# EAGLE design ELE Can-Bus Shield-V1.5-20190730-01 (EAGLE 8.2.0)
DESCRIPTION: microOBD 200 OBD-II Module; HW_REV: 1.4; PCB_REV: C; PCB_SPEC1: Layer Count: 4; PCB_SPEC2: Size: 1.3" x 0.59"; PCB_SPEC3: Finish Thickness: 0.049" - 0.052"; PCB_SPEC4: Copper Weight: 1oz; TITLE: STM1120
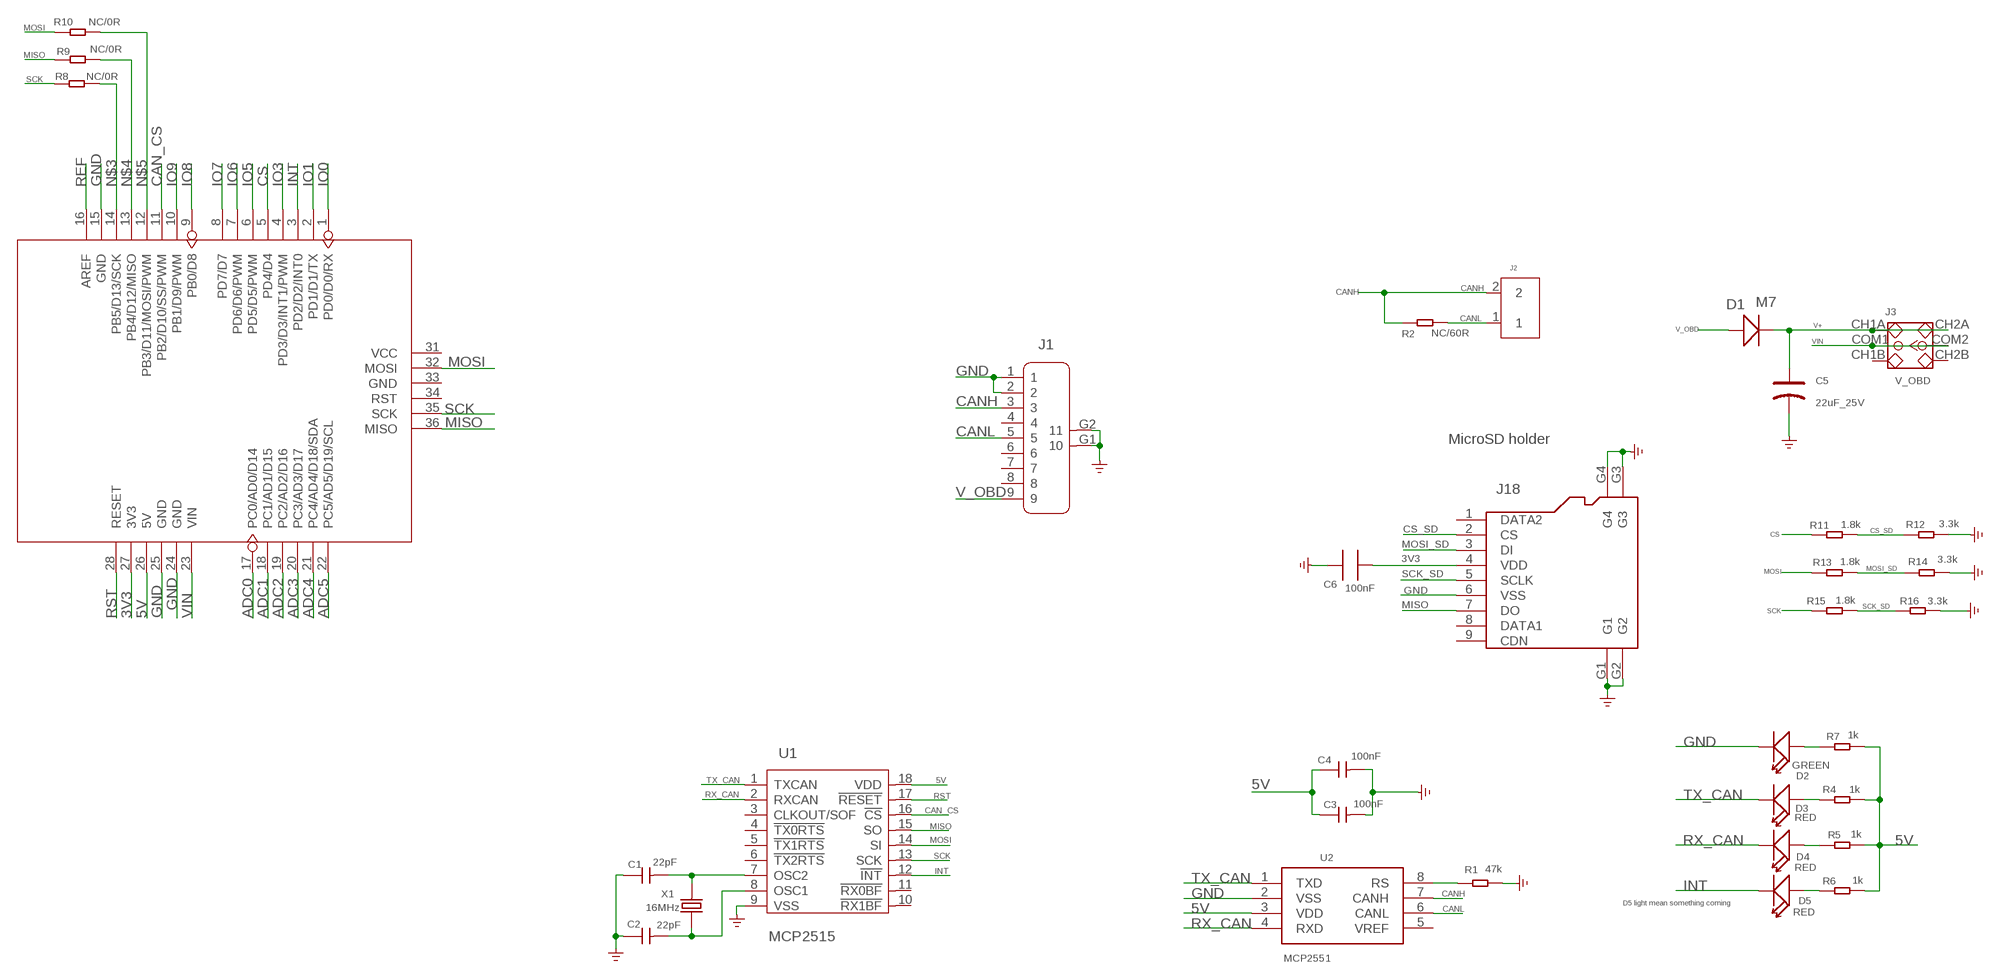
[diagram p0: schematic, sheet 1]

## Parts
C1  22pF  C-0603  [0603]
C2  22pF  C-0603  [0603]
C3  100nF  C-0603  [0603]
C4  100nF  C-0603  [0603]
C5  22uF_25V  CAP-AVX-C  [AVX-C]
C6  100nF  C0603  [0603]
D1  M7  D-SMA  [D2010]
D2  GREEN  LED'0603'  [LED-0603]
D3  RED  LED'0603'  [LED-0603]
D4  RED  LED'0603'  [LED-0603]
D5  RED  LED'0603'  [LED-0603]
J1  DB9'MEAL'  [DB9-MEAL]
J2  SCREW-TERMINAL-2P5.0  [2P-5.0]
J3  V_OBD  SWITCH-2CH-6P  [6P-2CH-2.54-7.6X3.0]
J18  HOLDER-MICROSD-9P  [9P-SMD-W/-RING]
R1  47k  R-0603  [R0603]
R2  NC/60R  R0603  [0603]
R4  1k  R-0603  [R0603]
R5  1k  R-0603  [R0603]
R6  1k  R-0603  [R0603]
R7  1k  R-0603  [R0603]
R8  NC/0R  DISCRETE_R-0603  [DISCRETE_R0603]
R9  NC/0R  DISCRETE_R-0603  [DISCRETE_R0603]
R10  NC/0R  DISCRETE_R-0603  [DISCRETE_R0603]
R11  1.8k  R0603  [0603]
R12  3.3k  R0603  [0603]
R13  1.8k  R0603  [0603]
R14  3.3k  R0603  [0603]
R15  1.8k  R0603  [0603]
R16  3.3k  R0603  [0603]
U1  MCP2515  [SOIC18]
U2  MCP2551  [SO08]
U4  ARDUINO  [ARDUINO]
X1  16MHz  CRYSTAL-HC49S  [HC49/S]

## Nets
3V3: C6.2 J18.4(VDD) U4.27(3V3)
5V: C3.1 C4.1 R4.2 R5.2 R6.2 R7.2 U1.18(VDD) U2.3(VDD) U4.26(5V)
ADC0: U4.17(PC0/AD0/D14)
ADC1: U4.18(PC1/AD1/D15)
ADC2: U4.19(PC2/AD2/D16)
ADC3: U4.20(PC3/AD3/D17)
ADC4: U4.21(PC4/AD4/D18/SDA)
ADC5: U4.22(PC5/AD5/D19/SCL)
CAN_CS: U1.16(!CS) U4.11(PB2/D10/SS/PWM)
CANH: J1.3 J2.2 R2.1 U2.7(CANH)
CANL: J1.5 J2.1 R2.2 U2.6(CANL)
CS: R11.1 U4.5(PD4/D4)
CS_SD: J18.2(CS) R11.2 R12.1
GND: C1.1 C2.1 C3.2 C4.2 C5.- C6.1 D2.- J1.1 J1.2 J1.G1 J1.G2 J18.6(VSS) J18.G1 J18.G2 J18.G3 J18.G4 R1.2 R12.2 R14.2 R16.2 U1.9(VSS) U2.2(VSS) U4.15(GND) U4.24(GND) U4.25(GND)
INT: D5.- U1.12(!INT) U4.3(PD2/D2/INT0)
IO0: U4.1(PD0/D0/RX)
IO1: U4.2(PD1/D1/TX)
IO3: U4.4(PD3/D3/INT1/PWM)
IO5: U4.6(PD5/D5/PWM)
IO6: U4.7(PD6/D6/PWM)
IO7: U4.8(PD7/D7)
IO8: U4.9(PB0/D8)
IO9: U4.10(PB1/D9/PWM)
MISO: J18.7(DO) R9.2 U1.15(SO) U4.36(MISO)
MOSI: R10.2 R13.1 U1.14(SI) U4.32(MOSI)
MOSI_SD: J18.3(DI) R13.2 R14.1
N$1: D2.+ R7.1
N$2: D3.+ R4.1
N$3: R8.1 U4.14(PB5/D13/SCK)
N$4: R9.1 U4.13(PB4/D12/MISO)
N$5: R10.1 U4.12(PB3/D11/MOSI/PWM)
N$15: D4.+ R5.1
N$16: C1.2 U1.7(OSC2) X1.2
N$17: C2.2 U1.8(OSC1) X1.1
N$19: D5.+ R6.1
N$20: R1.1 U2.8(RS)
REF: U4.16(AREF)
RST: U1.17(!RESET) U4.28(RESET)
RX_CAN: D4.- U1.2(RXCAN) U2.4(RXD)
SCK: R8.2 R15.1 U1.13(SCK) U4.35(SCK)
SCK_SD: J18.5(SCLK) R15.2 R16.1
TX_CAN: D3.- U1.1(TXCAN) U2.1(TXD)
V+: C5.+ D1.- J3.CH1A J3.CH2A
V_OBD: D1.+ J1.9
VIN: J3.COM1 J3.COM2 U4.23(VIN)
Unconnected: J1.4 J1.6 J1.7 J1.8 J3.CH1B J3.CH2B J18.1(DATA2) J18.8(DATA1) J18.9(CDN) U1.3(CLKOUT/SOF) U1.4(!TX0RTS) U1.5(!TX1RTS) U1.6(!TX2RTS) U1.10(!RX1BF) U1.11(!RX0BF) U2.5(VREF) U4.31(VCC) U4.33(GND) U4.34(RST)

## Notes on the sheet
- MicroSD holder
- D5 light mean something coming

## Library data of the parts
C1-C4 = Discrete:C*: Ceramic Capacitors
C5 = Discrete:CAP*: Electrolytic Capacitors,Tantalum Capacitors and Super Capacitors
C6 = CPT_SMD:C0603; C0603: 100N
D1 = Discrete:D*
D2-D5 = Discrete:LED*
J1 = Connector:DB9
J2 = Connector:SCREW-TERMINAL-2P
J3 = Discrete:SWITCH-2CH-6P
J18 = Connector:HOLDER-MICROSD-9P
R1 R4-R7 = Discrete:R*
R2 R11-R16 = CPT_SMD:R0603
R8-R10 = A_xbj:DISCRETE_R*
U1 = IC:MCP2515: Stand-Alone CAN Controller With SPI Interface
U2 = IC:MCP2551: High-Speed CAN Transceiver http://ww1.microchip.com/downloads/en/devicedoc/21667f.pdf
U4 = moudle:ARDUINO
X1 = Discrete:CRYSTAL*: CRYSTAL

## Net classes
0 default: width 0.305 mm, drill 0.305 mm, clearance 0.305 mm

## Board
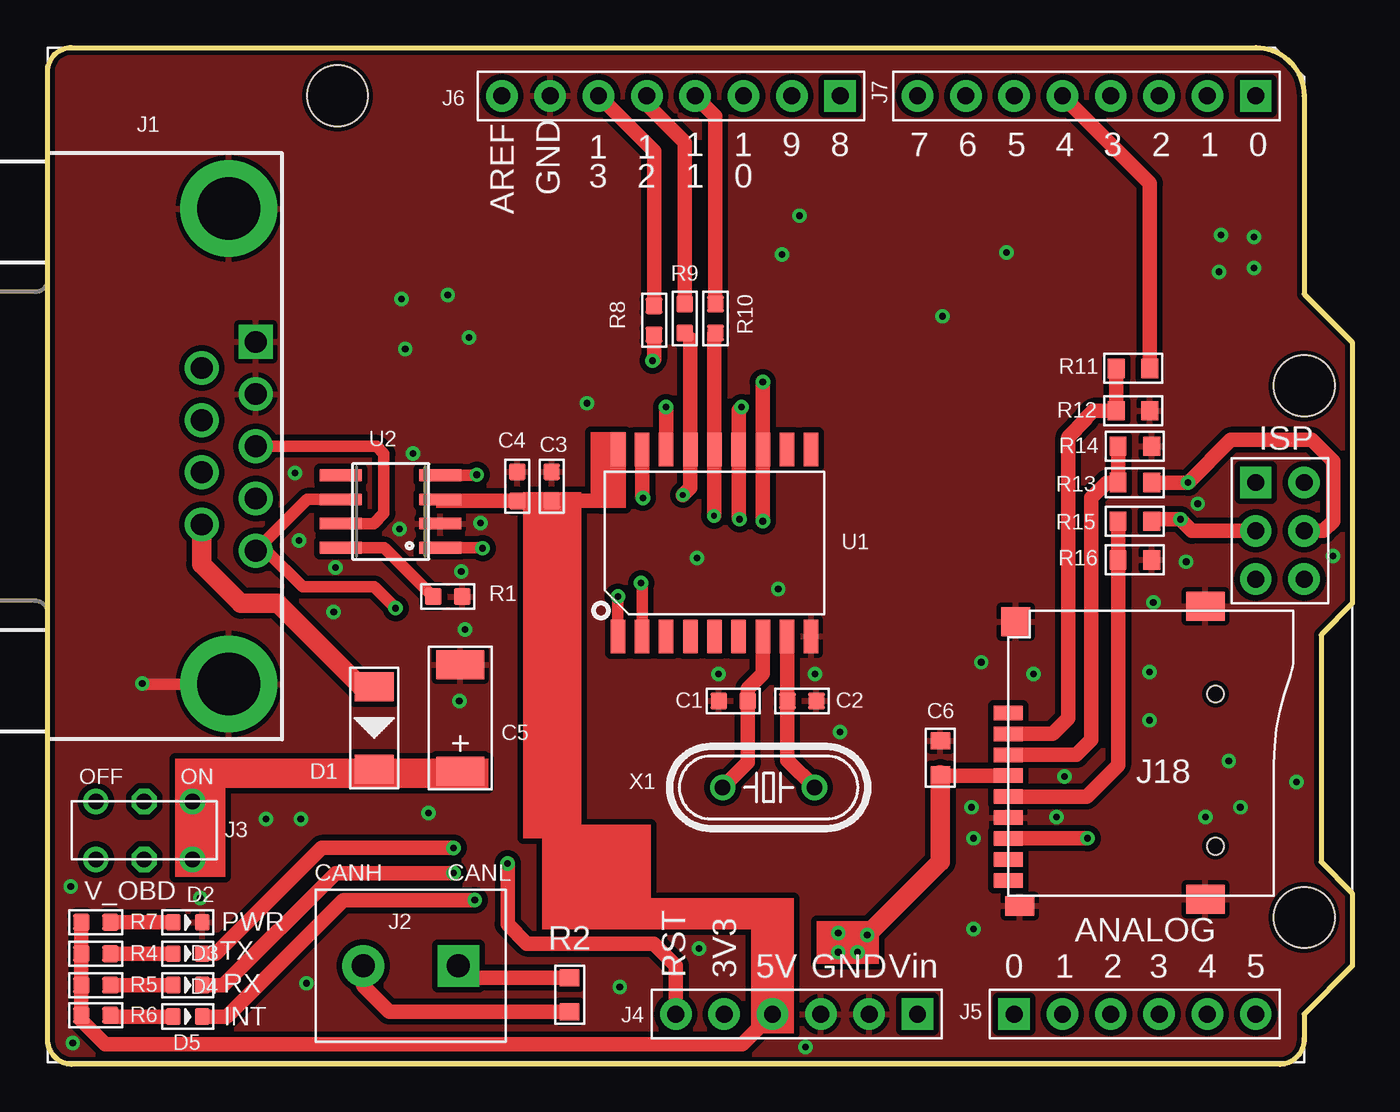
[diagram p1: board, top side]
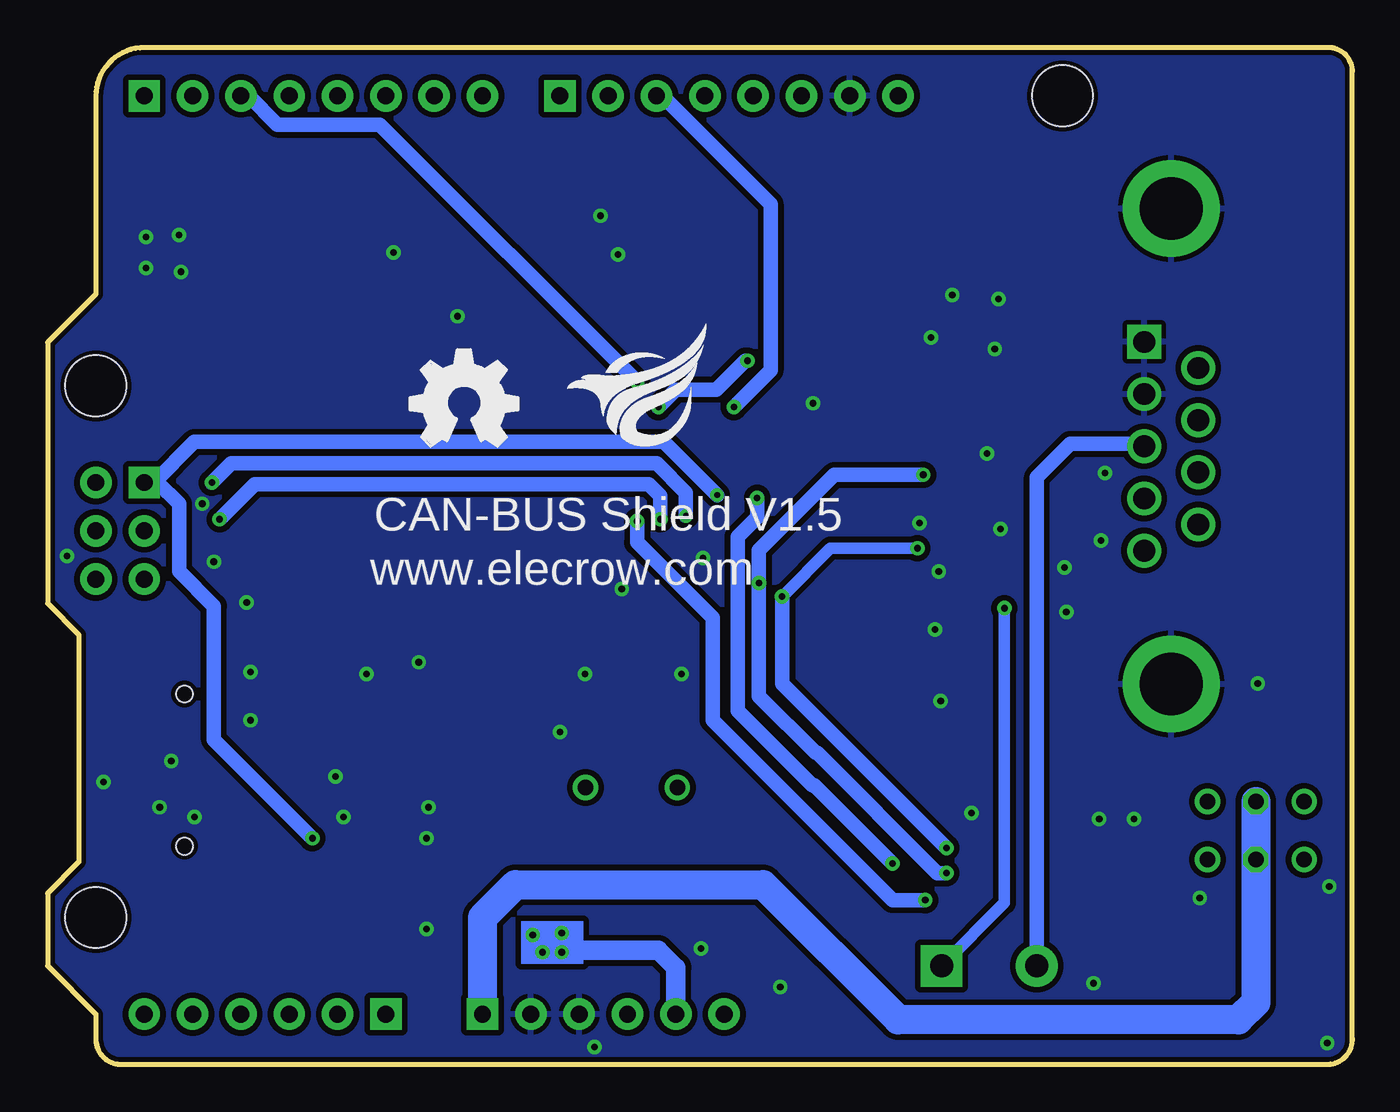
[diagram p2: board, bottom side, seen from below]

Size 68.58 x 53.44 mm. Coordinates in mm from the lower left corner, seen from the top.
Outline: 66.04,2.64 66.04,1.37 arc-90 64.77,0 1.27,0 arc-90 0,1.37 0,52.17 arc-90 1.27,53.44 63.5,53.44 arc-90 66.04,50.9 66.04,40.49 68.58,37.95 68.58,24.23 66.93,22.58 66.93,10.64 68.58,8.99 68.58,5.18 66.04,2.64
Copper layers (1*16): Top 0.035mm / dielectric 1.5mm / Bottom 0.035mm
Design rules "default *": minimum track width 10mil, minimum drill 12mil, track to track 8mil, track to pad 8mil, pad to pad 8mil, via to via 8mil, smd to smd 8mil, copper to edge 10mil, drill to drill 8mil, minimum pad ring 10mil, minimum via ring 8mil, stop-mask expansion 4mil, vias tented up to drill 100mil, thermal gap 10mil

### Footprints (pad centres in the part's own frame; a part is rotated, then mirrored left to right if it is on the bottom)
0603 = smd 0.889 x 0.889: 1 -0.762,0; 2 0.762,0
AVX-C = smd 1.524 x 2.54: + -2.794,0; - 2.794,0
0603' = smd 0.889 x 1.016: 1 -0.889,0; 2 0.889,0
D2010 = smd 1.524 x 2.032: + -2.159,0; - 2.159,0
LED-0603 = smd 0.762 x 0.889: + -0.762,0; - 0.762,0
DB9-MEAL = drill 1.143 pad 1.778 square: 1 -5.486,1.422 | drill 1.143 pad 1.778: 2 -2.743,1.422; 3 0,1.422; 4 2.743,1.422; 5 5.486,1.422; 6 -4.115,-1.422; 7 -1.372,-1.422; 8 1.372,-1.422; 9 4.115,-1.422 | drill 3.302 pad 5.08: G1 12.497,0; G2 -12.497,0
2P-5.0 = drill 1.2 pad 2.184 square: 1 0,0 | drill 1.2 pad 2.184: 2 5,0
6P-2CH-2.54-7.6X3.0 = drill 0.813 pad 1.27: CH1A -1.524,2.54; CH1B -1.524,-2.54; CH2A 1.524,2.54; CH2B 1.524,-2.54 | drill 0.813 pad 1.27 octagon: COM1 -1.524,0; COM2 1.524,0
9P-SMD-W/-RING = smd 1.524 x 0.762: 1 0,4.4; 2 0,3.3; 3 0,2.2; 4 0,1.1; 5 0,0; 6 0,-1.1; 7 0,-2.2; 8 0,-3.3; 9 0,-4.4 | smd 1.524 x 1.016: G1 0.6,-5.746 | smd 2.032 x 1.524: G2 10.373,-5.4; G3 10.373,10 | smd 1.524 x 1.524: G4 0.392,9.181 | hole 0.889: 10.9,-2.6; 10.9,5.4
R0603 = smd 0.889 x 0.889: 1 -0.762,0; 2 0.762,0
DISCRETE_R0603 = smd 0.889 x 0.889: 1 -0.762,0; 2 0.762,0
SOIC18 = smd 0.762 x 1.778: 1 -5.08,-4.915; 2 -3.81,-4.915; 3 -2.54,-4.915; 4 -1.27,-4.915; 5 0,-4.915; 6 1.27,-4.915; 7 2.54,-4.915; 8 3.81,-4.915; 9 5.08,-4.915; 10 5.08,4.915; 11 3.81,4.915; 12 2.54,4.915; 13 1.27,4.915; 14 0,4.915; 15 -1.27,4.915; 16 -2.54,4.915; 17 -3.81,4.915; 18 -5.08,4.915
SO08 = smd 0.61 x 2.21: 1 -1.905,-2.616; 2 -0.635,-2.616; 3 0.635,-2.616; 4 1.905,-2.616; 5 1.905,2.616; 6 0.635,2.616; 7 -0.635,2.616; 8 -1.905,2.616
ARDUINO = drill 0.889 pad 1.651 square: 1 63.5,50.8; 9 41.656,50.8; 17 50.8,2.54; 23 45.72,2.54; 36 63.5,30.48 | drill 0.889 pad 1.651: 2 60.96,50.8; 3 58.42,50.8; 4 55.88,50.8; 5 53.34,50.8; 6 50.8,50.8; 7 48.26,50.8; 8 45.72,50.8; 10 39.116,50.8; 11 36.576,50.8; 12 34.036,50.8; 13 31.496,50.8; 14 28.956,50.8; 15 26.416,50.8; 16 23.876,50.8; 18 53.34,2.54; 19 55.88,2.54; 20 58.42,2.54; 21 60.96,2.54; 22 63.5,2.54; 24 43.18,2.54; 25 40.64,2.54; 26 38.1,2.54; 27 35.56,2.54; 28 33.02,2.54; 31 66.04,30.48; 32 66.04,27.94; 33 66.04,25.4; 34 63.5,25.4; 35 63.5,27.94 | hole 3.2: 15.24,50.8; 66.04,35.56; 66.04,7.62
HC49/S = drill 0.813: 1 -2.413,0; 2 2.413,0

### Placement (x,y rotation side)
C1  36.04,19.1 0 top
C2  39.65,19.1 180 top
C3  26.49,30.38 90 top
C4  24.69,30.38 90 top
C5  21.69,18.21 90 top
C6  100nF  [0603']  46.93,16.12 270 top
D1  17.17,17.68 270 top
D2  7.37,7.47 0 top
D3  7.37,5.82 0 top
D4  7.37,4.17 0 top
D5  7.37,2.51 0 top
J1  9.53,32.49 270 top
J2  21.59,5.18 180 top
J3  5.08,12.29 270 top
J18  50.48,14.07 0 top
R1  21.03,24.59 0 top
R2  NC/60R  [0603']  27.43,3.66 90 top
R4  2.54,5.82 180 top
R5  2.54,4.17 180 top
R6  2.54,2.58 180 top
R7  2.54,7.47 180 top
R8  31.88,39.1 270 top
R9  33.49,39.2 270 top
R10  35.1,39.2 270 top
R11  1.8k  [0603']  57.05,36.58 180 top
R12  3.3k  [0603']  57.05,34.35 0 top
R13  1.8k  [0603']  57.15,30.58 180 top
R14  3.3k  [0603']  57.15,32.49 0 top
R15  1.8k  [0603']  57.15,28.55 180 top
R16  3.3k  [0603']  57.15,26.52 0 top
U1  35.05,27.41 0 top
U2  18.03,29.06 90 top
U4  0,0.1 0 top
U$1  [ELECROW_NRW_6]  41.27,32.49 0 bottom
U$2  [OSHW_FILLX200_NOTEXT]  49.53,32.49 0 bottom
X1  37.9,14.55 180 top

### Tracks (layer width: path | path; a pad name or v marks a point on that pad's centre or on a via)
3V3  (via drill 0.35)
  Top 0.61: v43.08,6.81 41.66,6.81 v41.55,6.91 | v43.08,6.81 42.47,6.81 v41.55,5.89 | v43.08,6.81 43.08,6.4 v42.57,5.89
  Top 0.762: J18.4 46.98,15.17 C6.2
  Top 1.016: C6.2 46.93,10.66 v43.08,6.81
  Bottom 0.61: v41.55,6.91 41.45,6.91 40.54,5.99
  Bottom 1.016: U4.27 35.56,5.08 36.47,5.99 40.54,5.99 42.27,5.99 v43.08,6.81
5V
  Top 0.61: U2.3 24.61,29.69 C4.1
  Top 0.762: C4.1 C3.1 | C3.1 29.11,29.62 29.97,30.48 U1.18 | R7.2 R4.2 R5.2 R6.2 1.78,2.31 3.04,1.05 36.51,1.05 U4.26 38.1,6.6 36.78,7.92 31.5,7.92 26.49,12.93 C3.1
CAN_CS  (via drill 0.35)
  Top 0.762: U1.16 v32.51,34.54
  Bottom 0.762: U4.11 36.27,50.9 30.58,45.21 30.58,36.47 v32.51,34.54
CANH
  Top 0.61: J1.3 17.3,32.49 17.68,32.11 17.68,28.96 17.14,28.42 U2.7
  Top 0.762: J2.2 16.59,4.14 17.96,2.77 R2.1
  Bottom 0.762: J2.2 16.59,30.86 14.83,32.61 11.07,32.61 J1.3
CANL  (via drill 0.35)
  Top 0.61: U2.6 13.64,29.69 J1.5 11.51,27 13.41,25.1 17.17,25.1 v18.29,23.98
  Top 0.762: R2.2 22.23,4.55 J2.1
  Bottom 0.61: v18.29,23.98 18.29,8.48 J2.1
CS
  Top 0.762: R11.1 57.94,46.3 U4.5
CS_SD
  Top 0.762: J18.2 52.83,17.37 53.65,18.19 53.65,32.97 54.57,33.9 54.57,33.95 54.97,34.34 56.15,34.34 | R12.1 56.15,34.34 | R11.2 R12.1 | R12.1 56.15,34.34
GND  (via drill 0.35 pad 0.55)
  Top 0.61: J1.G1 5,19.99 v4.98,20.02
  other vias: 53.44,15.14 39.83,0.91 39.52,44.6 38.61,42.57 47.04,39.32 50.39,42.67 41.66,17.48 48.56,13.51 48.67,11.89 21.95,22.86 34.14,26.62 38.4,24.99 28.35,34.75 11.48,12.9 13.31,12.9 1.22,9.35 1.32,1.12 18.49,28.14 22.76,28.45 19.2,32.11 13,31.09 13.21,27.53 15.14,26.11 67.56,26.72 60.45,29.46 59.84,26.42 58.12,24.28 53.04,13 15.04,23.77 35.26,20.52 40.34,20.52 8.03,8.74 18.59,40.23 21.03,40.44 18.8,37.59 22.15,38.2 60.86,13 62.08,15.95 62.69,13.51 65.63,14.83 48.67,7.11 57.91,18.08 57.91,20.62 49.07,21.13 51.82,20.52 21.64,19.1 20.02,13.21 21.74,25.91 61.67,43.59 61.57,41.66 63.4,43.48 63.4,41.86 30.07,4.06 34.24,6.1 13.61,4.27
  pour Top: -6.1,56.08 -6.1,-3.45 71.73,-3.45 71.73,56.08
  pour Bottom: -4.78,54.76 -4.78,-2.34 70.41,-2.34 70.41,54.76
INT  (via drill 0.35)
  Top 0.762: v37.59,28.55 U1.12 v37.59,35.86 | v22.45,8.64 15.54,8.64 9.42,2.51 D5.-
  Bottom 0.762: v37.59,28.55 37.59,27.43 33.63,23.47 33.63,18.1 24.16,8.64 v22.45,8.64 | v37.59,35.86 51.12,49.39 56.51,49.39 58.02,50.9 U4.3
MISO  (via drill 0.3, 0.35)
  Top 0.762: v33.39,29.92 33.78,30.31 U1.15 33.78,38.15 R9.2 | v54.66,11.89 50.5,11.89 J18.7
  Bottom 0.762: v33.39,29.92 36.18,32.72 60.86,32.72 62.99,30.58 U4.36 62.79,30.58 61.67,29.46 61.67,25.91 59.84,24.08 59.84,17.07 v54.66,11.89
MOSI  (via drill 0.3, 0.35)
  Top 0.762: R10.2 35.05,38.39 U1.14 35.05,29.57 | R13.1 v59.94,30.58 62.18,32.82 66.45,32.82 67.56,31.7 67.56,28.55 67.06,28.04 U4.32 | 35.03,28.85 35.05,28.88 35.05,29.57 | 35.05,29.57 35.05,28.85 v35.03,28.83
  Bottom 0.762: v59.94,30.58 58.93,31.6 36.58,31.6 35.03,30.05 v35.03,28.83
MOSI_SD
  Top 0.762: J18.3 54.07,16.27 54.86,17.07 54.86,29.77 55.68,30.58 R13.2 R14.1
N$1
  Top 0.762: R7.1 D2.+
N$2
  Top 0.762: D3.+ R4.1
N$3
  Top 0.762: R8.1 31.88,47.98 U4.14
N$4
  Top 0.762: R9.1 33.49,48.46 33,48.95 31.5,50.46 U4.13
N$5
  Top 0.762: U4.12 35.1,49.83 R10.1
N$15
  Top 0.762: D4.+ R5.1
N$16
  Top 0.762: X1.2 36.8,15.87 C1.2 36.8,19.74 37.59,20.52 U1.7
N$17
  Top 0.762: X1.1 38.89,15.98 C2.2 38.89,22.47 U1.8
N$19
  Top 0.762: D5.+ 3.37,2.51 R6.1
N$20
  Top 0.61: R1.1 17.7,27.15 U2.8
RST  (via drill 0.35)
  Top 0.762: U1.17 31.24,29.82 v31.29,29.77 | v24.18,10.57 24.18,7.37 25.2,6.35 31.85,6.35 33.02,5.18 U4.28
  Bottom 0.762: v31.29,29.77 31.29,28.75 32.31,27.74 32.31,18.59 28.4,14.68 28.3,14.68 v24.18,10.57
RX_CAN  (via drill 0.35)
  Top 0.61: U2.4 22.53,30.96 v22.55,30.99 | U1.2 31.24,25.25 v31.19,25.3
  Top 0.762: D4.- 9.25,4.17 15.14,10.06 v21.34,10.06
  Bottom 0.762: v21.34,10.06 21.82,10.06 28.13,16.37 28.21,16.37 31.19,19.35 v31.19,25.3 31.19,27.03 27.23,30.99 v22.55,30.99
SCK  (via drill 0.35)
  Top 0.762: R8.2 31.88,37.06 v31.8,36.98 | v36.47,34.54 36.32,34.39 U1.13 36.32,28.7 v36.37,28.65 | R15.1 58.14,28.65 v59.54,28.65 60.15,28.04 U4.35
  Bottom 0.762: v36.37,28.65 36.37,29.89 36.98,30.49 57.7,30.49 v59.54,28.65 | v31.8,36.98 31.9,36.98 33.43,35.46 35.56,35.46 v36.47,34.54
SCK_SD
  Top 0.762: R15.2 R16.1 56.26,15.72 54.61,14.07 J18.5
TX_CAN  (via drill 0.35)
  Top 0.61: U2.1 22.84,27.15 v22.86,27.13 | v29.97,24.59 U1.1
  Top 0.762: D3.- 8.84,5.82 14.4,11.38 v21.34,11.38
  Bottom 0.61: v22.86,27.13 27.43,27.13 v29.97,24.59
  Bottom 0.762: v29.97,24.59 29.97,20.02 v21.34,11.38
V+
  Top 1.016: J3.CH2A J3.CH1A 7.62,14.83 8.23,15.44 17.09,15.44 D1.- 21.59,15.52 C5.+
V_OBD
  Top 1.016: J1.9 8.1,26.29 10.16,24.23 12.09,24.23 16.48,19.84 D1.+
VIN
  Bottom 1.524: J3.COM1 J3.COM2 5.08,3.25 5.99,2.34 23.88,2.34 30.99,9.45 43.99,9.45 45.72,7.72 U4.23
(copper drawn outside any net)
  shapes: Bottom area x1, Top area x11

### Text on the board
tPlace: J7 | J6 | OFF | ON | CANH | CANL | V_OBD | PWR | TX | RX | J4 | J5 | INT
bPlace: CAN-BUS Shield V1.5 | www.elecrow.com
tNames: ISP